# EasyEDA Pro project H7MS-native-footprint-checked-20261017.epro, board H7MS_CORE_H735_A1_核心板PCB
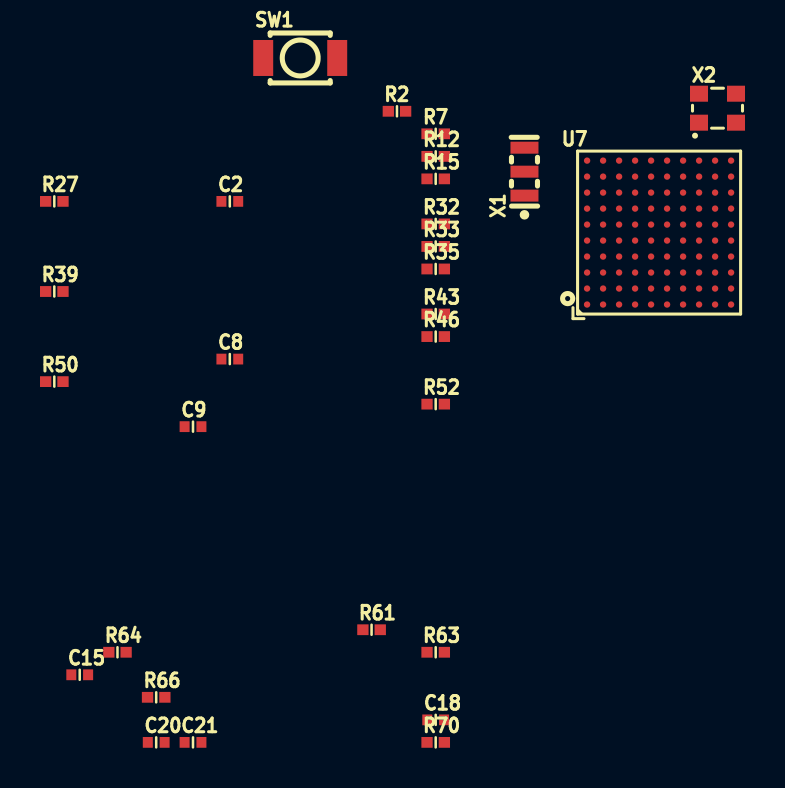
[diagram p8: board, top side]
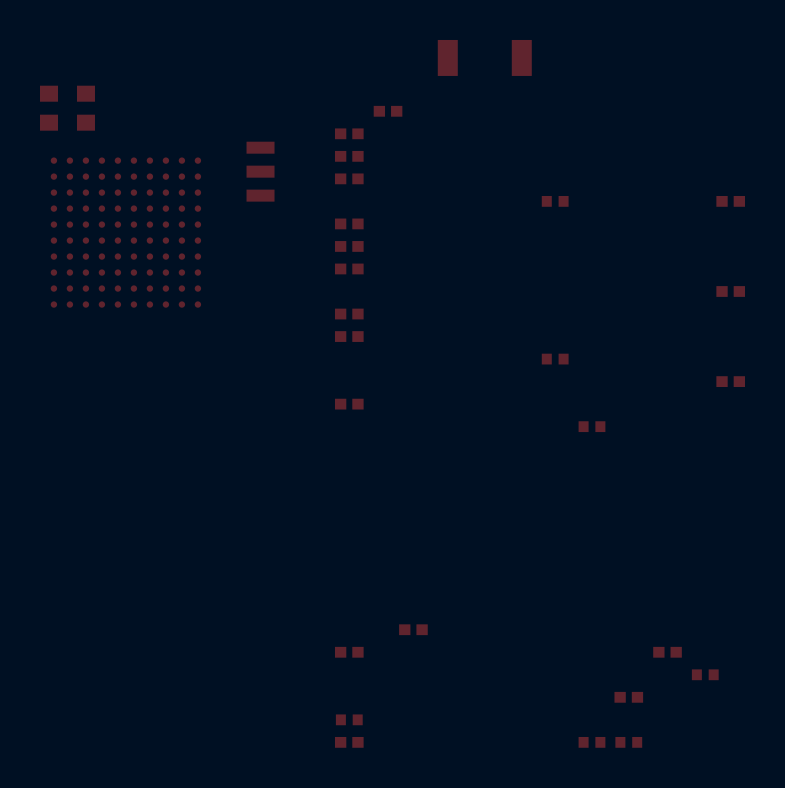
[diagram p9: board, bottom side, seen from below]

No outline. copper layers: Top Layer, Bottom Layer. Coordinates in mm from the lowest, leftmost part position.
Stack: Top Layer 0.035mm / Dielectric1 1.51mm FR4 er 4.5 / Bottom Layer 0.035mm

## Design rules (mm)
spacing copperThickness1oz (default): track to track 0.102, other pairs 0.152 to 0.3
spacing copperThickness2oz: track to track 0.203, other pairs 0.152 to 0.3
track width copperThickness1oz (default): min 0.127, default 0.254, max 2.54
track width copperThickness2oz: min 0.203, default 0.254, max 2.54
differential pair differentialPair (default): width min 0.127, default 0.254, max 2.54; gap min 0.152, default 0.152

## Placement (name value [footprint] x y rotation side)
C2  100nF  [C0402]  8.78 27.07 0 top
C8  100nF  [C0402]  8.78 19.18 0 top
C9  100nF  [C0402]  6.94 15.8 0 top
C15  2.2uF  [C0402]  1.27 3.38 0 top
C18  2.2uF  [C0402]  19.07 1.13 0 top
C20  100nF  [C0402]  5.09 0 0 top
C21  1uF  [C0402]  6.94 0 0 top
R2  10kΩ  [R0402]  17.13 31.57 0 top
R7  22Ω  [R0402]  19.07 30.45 0 top
R12  22Ω  [R0402]  19.07 29.32 0 top
R15  22Ω  [R0402]  19.07 28.19 0 top
R27  22Ω  [R0402]  0 27.07 0 top
R32  22Ω  [R0402]  19.07 25.94 0 top
R33  22Ω  [R0402]  19.07 24.81 0 top
R35  22Ω  [R0402]  19.07 23.68 0 top
R39  22Ω  [R0402]  0 22.56 0 top
R43  22Ω  [R0402]  19.07 21.43 0 top
R46  22Ω  [R0402]  19.07 20.3 0 top
R50  22Ω  [R0402]  0 18.05 0 top
R52  22Ω  [R0402]  19.07 16.92 0 top
R61  10kΩ  [R0402]  15.86 5.64 0 top
R63  22Ω  [R0402]  19.07 4.51 0 top
R64  22Ω  [R0402]  3.16 4.51 0 top
R66  10kΩ  [R0402]  5.09 2.25 0 top
R70  22Ω  [R0402]  19.07 0 0 top
SW1  HX TS253015A2P 160gf  [KEY-SMD_L3.0-W2.5-LS4.0_TD-1183SN]  12.29 34.24 0 top
U7  STM32H743VIH6  [BGA-100_L8.0-W8.0-P0.80-R10-C10-BL]  30.24 25.51 0 top
X1  8MHz  [OSC-SMD_3P-L3.2-W1.3-P1.20-L]  23.51 28.55 90 top
X2  8MHz  [OSC-SMD_4P-L2.5-W2.0-BL-1]  33.16 31.73 0 top

## Footprints (pads in the part's own frame, mm; a bottom-side part is the same pattern mirrored in y, then rotated)
BGA-100_L8.0-W8.0-P0.80-R10-C10-BL
  round 0.32 smd: A1(-3.6,-3.6) A2(-3.6,-2.8) A3(-3.6,-2) A4(-3.6,-1.2) A5(-3.6,-0.4) A6(-3.6,0.4) A7(-3.6,1.2) A8(-3.6,2) A9(-3.6,2.8) A10(-3.6,3.6) B1(-2.8,-3.6) B2(-2.8,-2.8) B3(-2.8,-2) B4(-2.8,-1.2) B5(-2.8,-0.4) B6(-2.8,0.4) B7(-2.8,1.2) B8(-2.8,2) B9(-2.8,2.8) B10(-2.8,3.6) C1(-2,-3.6) C2(-2,-2.8) C3(-2,-2) C4(-2,-1.2) C5(-2,-0.4) C6(-2,0.4) C7(-2,1.2) C8(-2,2) C9(-2,2.8) C10(-2,3.6) D1(-1.2,-3.6) D2(-1.2,-2.8) D3(-1.2,-2) D4(-1.2,-1.2) D5(-1.2,-0.4) D6(-1.2,0.4) D7(-1.2,1.2) D8(-1.2,2) D9(-1.2,2.8) D10(-1.2,3.6) E1(-0.4,-3.6) E2(-0.4,-2.8) E3(-0.4,-2) E4(-0.4,-1.2) E5(-0.4,-0.4) E6(-0.4,0.4) E7(-0.4,1.2) E8(-0.4,2) E9(-0.4,2.8) E10(-0.4,3.6) F1(0.4,-3.6) F2(0.4,-2.8) F3(0.4,-2) F4(0.4,-1.2) F5(0.4,-0.4) F6(0.4,0.4) F7(0.4,1.2) F8(0.4,2) F9(0.4,2.8) F10(0.4,3.6) G1(1.2,-3.6) G2(1.2,-2.8) G3(1.2,-2) G4(1.2,-1.2) G5(1.2,-0.4) G6(1.2,0.4) G7(1.2,1.2) G8(1.2,2) G9(1.2,2.8) G10(1.2,3.6) H1(2,-3.6) H2(2,-2.8) H3(2,-2) H4(2,-1.2) H5(2,-0.4) H6(2,0.4) H7(2,1.2) H8(2,2) H9(2,2.8) H10(2,3.6) J1(2.8,-3.6) J2(2.8,-2.8) J3(2.8,-2) J4(2.8,-1.2) J5(2.8,-0.4) J6(2.8,0.4) J7(2.8,1.2) J8(2.8,2) J9(2.8,2.8) J10(2.8,3.6) K1(3.6,-3.6) K2(3.6,-2.8) K3(3.6,-2) K4(3.6,-1.2) K5(3.6,-0.4) K6(3.6,0.4) K7(3.6,1.2) K8(3.6,2) K9(3.6,2.8) K10(3.6,3.6)
C0402
  rect 0.5x0.54 smd: 1(-0.42,0) 2(0.42,0)
KEY-SMD_L3.0-W2.5-LS4.0_TD-1183SN
  rect 1x1.8 smd: 1(-1.85,0) 2(1.85,0)
OSC-SMD_3P-L3.2-W1.3-P1.20-L
  rect 0.6x1.4 smd: 1(-1.199,0) 2(0,0) 3(1.199,0)
OSC-SMD_4P-L2.5-W2.0-BL-1
  rect 0.9x0.8 smd: 1(-0.925,-0.725) 2(0.925,-0.725) 3(0.925,0.725) 4(-0.925,0.725)
R0402
  rect 0.566x0.54 smd: 1(-0.433,0) 2(0.433,0)

## Nets
As in the schematic, except:
GND: C2.1 C8.1 C9.1 C15.1 C18.1 C20.1 C21.2 R2.1 X1.2
BOOT0: R2.2 SW1.2
MCU_3V3: C2.2 C8.2 C9.2 C20.2 C21.1 R61.2 R66.2 SW1.1

Pads without a net: C15 2; C18 2; R7 2; R12 2; R15 2; R27 1; R32 2; R33 2; R35 2; R39 1; R43 2; R46 2; R50 1; R52 2; R63 2; R70 2; U7 A1 A2 A3 A4 A5 A6 A7 A8 A9 A10 B1 B2 B3 B4 B5 B6 B7 B8 B9 B10 C1 C2 C3 C4 C5 C6 C7 C8 C9 C10 D1 D2 D3 D4 D5 D6 D7 D8 D9 D10 E1 E2 E3 E4 E5 E6 E7 E8 E9 E10 F1 F2 F3 F4 F5 F6 F7 F8 F9 F10 G1 G2 G3 G4 G5 G6 G7 G8 G9 G10 H1 H2 H3 H4 H5 H6 H7 H8 H9 H10 J1 J2 J3 J4 J5 J6 J7 J8 J9 J10 K1 K2 K3 K4 K5 K6 K7 K8 K9 K10; X2 1 2 3 4
